# Altium project Bitirme_Projesi_FG1000.PrjPcb
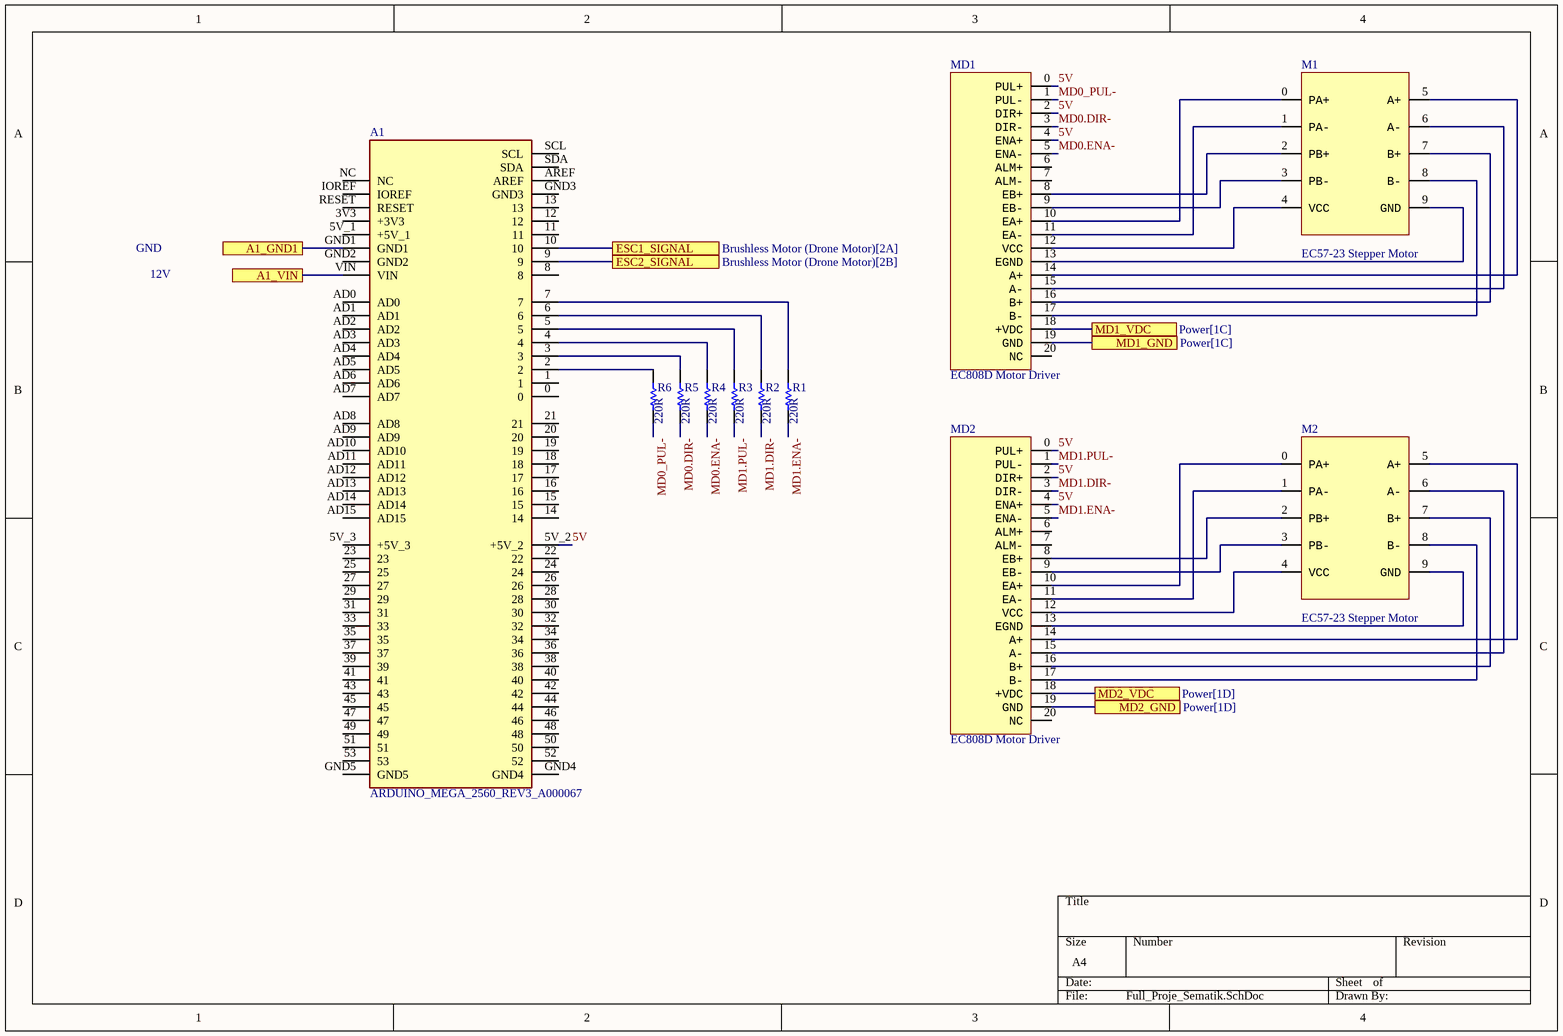
[diagram p0: Full_Proje_Sematik.SchDoc]
3 sheets, 54 parts. Net scope: flat (ports and power ports of the same name join across sheets).
Sheets:
  Full_Proje_Sematik.SchDoc
  Power.SchDoc
  Brushless Motor (Drone Motor).SchDoc

## Sheet Full_Proje_Sematik.SchDoc
size A4; SheetNumber: 1; SheetTotal: 3

### Parts
A1  ARDUINO_MEGA_2560_REV3_A000067  [ARDUINO_ARDUINO_MEGA_2560_REV3_A000067]
M1  EC57-23 Stepper Motor
M2  EC57-23 Stepper Motor
MD1  EC808D Motor Driver
MD2  EC808D Motor Driver
R1  value 220R  (hidden comment: Resistor)
R2  value 220R  (hidden comment: Resistor)
R3  value 220R  (hidden comment: Resistor)
R4  value 220R  (hidden comment: Resistor)
R5  value 220R  (hidden comment: Resistor)
R6  value 220R  (hidden comment: Resistor)

### Ports
A1_GND1, A1_VIN, ESC1_SIGNAL (see Brushless Motor (Drone Motor)[2A]), ESC2_SIGNAL (see Brushless Motor (Drone Motor)[2B]), MD1_GND (see Power[1C]), MD1_VDC (see Power[1C]), MD2_GND (see Power[1D]), MD2_VDC (see Power[1D])

### Nets
GND: MD1.19(GND) MD2.19(GND) ; port MD1_GND, port MD2_GND
5V: A1.5V_2(+5V_2) MD1.0(PUL+) MD1.2(DIR+) MD1.4(ENA+) MD2.0(PUL+) MD2.2(DIR+) MD2.4(ENA+)
48VDC: MD1.18(+VDC) MD2.18(+VDC) ; port MD1_VDC, port MD2_VDC
MD0.DIR-: MD1.3(DIR-) R5.2
MD0.ENA-: MD1.5(ENA-) R4.2
MD0_PUL-: MD1.1(PUL-) R6.2
MD1.DIR-: MD2.3(DIR-) R2.2
MD1.ENA-: MD2.5(ENA-) R1.2
MD1.PUL-: MD2.1(PUL-) R3.2
NetA1_2: A1.2 R6.1
NetA1_3: A1.3 R5.1
NetA1_4: A1.4 R4.1
NetA1_5: A1.5 R3.1
NetA1_6: A1.6 R2.1
NetA1_7: A1.7 R1.1
NetA1_9: A1.9 ; port ESC2_SIGNAL
NetA1_10: A1.10 ; port ESC1_SIGNAL
NetA1_GND1: A1.GND1 ; port A1_GND1
NetA1_VIN: A1.VIN ; port A1_VIN
NetM1_0: M1.0(PA+) MD1.10(EA+)
NetM1_1: M1.1(PA-) MD1.11(EA-)
NetM1_2: M1.2(PB+) MD1.8(EB+)
NetM1_3: M1.3(PB-) MD1.9(EB-)
NetM1_4: M1.4(VCC) MD1.12(VCC)
NetM1_5: M1.5(A+) MD1.14(A+)
NetM1_6: M1.6(A-) MD1.15(A-)
NetM1_7: M1.7(B+) MD1.16(B+)
NetM1_8: M1.8(B-) MD1.17(B-)
NetM1_9: M1.9(GND) MD1.13(EGND)
NetM2_0: M2.0(PA+) MD2.10(EA+)
NetM2_1: M2.1(PA-) MD2.11(EA-)
NetM2_2: M2.2(PB+) MD2.8(EB+)
NetM2_3: M2.3(PB-) MD2.9(EB-)
NetM2_4: M2.4(VCC) MD2.12(VCC)
NetM2_5: M2.5(A+) MD2.14(A+)
NetM2_6: M2.6(A-) MD2.15(A-)
NetM2_7: M2.7(B+) MD2.16(B+)
NetM2_8: M2.8(B-) MD2.17(B-)
NetM2_9: M2.9(GND) MD2.13(EGND)

Not connected (* = marked no-connect by the designer): A1 0 1 3V3(+3V3) 5V_1(+5V_1) 5V_3(+5V_3) 8 11 12 13 14 15 16 17 18 19 20 21 22 23 24 25 26 27 28 29 30 31 32 33 34 35 36 37 38 39 40 41 42 43 44 45 46 47 48 49 50 51 52 53 AD0 AD1 AD2 AD3 AD4 AD5 AD6 AD7 AD8 AD9 AD10 AD11 AD12 AD13 AD14 AD15 AREF GND2 GND3 GND4 GND5 IOREF NC RESET SCL SDA; MD1 6(ALM+) 7(ALM-) 20(NC); MD2 6(ALM+) 7(ALM-) 20(NC)

### Notes on the sheet
- GND
- 12V

### Library data of the parts
A1 = ARDUINO_MEGA_2560_REV3_A000067: ATmega2560 Arduino Mega2560 AVRÂ® ATmega AVR MCU 8-Bit Embedded Evaluation Board; MP: ARDUINO MEGA 2560 REV3 ¦ A000067; SnapEDA_Link: https://www.snapeda.com/parts/ARDUINO%20MEGA%202560%20REV3%20%7C%20A000067/Arduino/view-part/?ref=snap; Package: Non-Standard Arduino; Value: *; MF: Arduino; Check_prices: https://www.snapeda.com/parts/ARDUINO%20MEGA%202560%20REV3%20%7C%20A000067/Arduino/view-part/?ref=eda
R1-R6 = Resistor: TC1: 0; SimulationGenericComponent: True; TC2: 0

## Sheet Power.SchDoc
size A4; SheetNumber: 2; SheetTotal: 3; SPICEModelCacheLUYUMUGJ: <root> / <DocumentId>LUYUMUGJ</DocumentId> / </root>
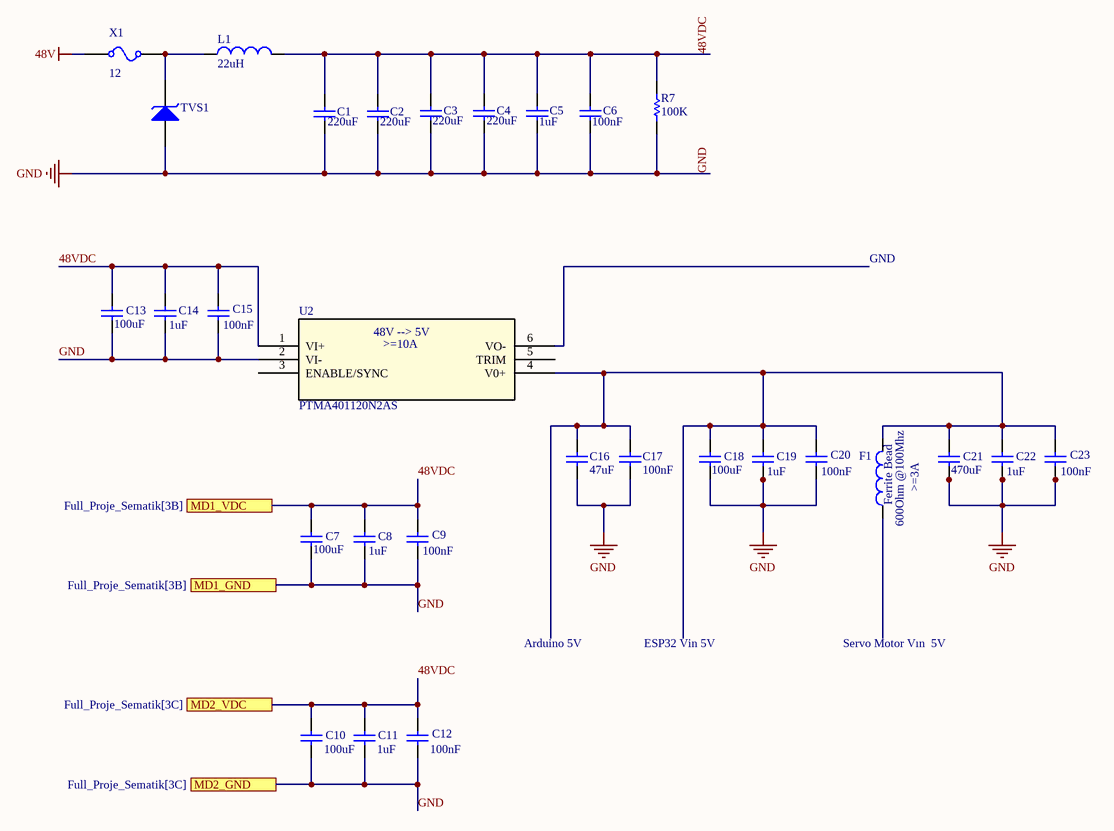
[diagram p1: Power.SchDoc]

### Parts
C1  value 220uF  (hidden comment: Capacitor)
C2  value 220uF  (hidden comment: Capacitor)
C3  value 220uF  (hidden comment: Capacitor)
C4  value 220uF  (hidden comment: Capacitor)
C5  value 1uF  (hidden comment: Capacitor)
C6  value 100nF  (hidden comment: Capacitor)
C7  value 100uF  (hidden comment: Capacitor)
C8  value 1uF  (hidden comment: Capacitor)
C9  value 100nF  (hidden comment: Capacitor)
C10  value 100uF  (hidden comment: Capacitor)
C11  value 1uF  (hidden comment: Capacitor)
C12  value 100nF  (hidden comment: Capacitor)
C13  value 100uF  (hidden comment: Capacitor)
C14  value 1uF  (hidden comment: Capacitor)
C15  value 100nF  (hidden comment: Capacitor)
C16  value 47uF  (hidden comment: Capacitor)
C17  value 100nF  (hidden comment: Capacitor)
C18  value 100uF  (hidden comment: Capacitor)
C19  value 1uF  (hidden comment: Capacitor)
C20  value 100nF  (hidden comment: Capacitor)
C21  value 470uF  (hidden comment: Capacitor)
C22  value 1uF  (hidden comment: Capacitor)
C23  value 100nF  (hidden comment: Capacitor)
F1  Ferrite Bead
L1  value 22uH  (hidden comment: Inductor)
R7  value 100K  (hidden comment: Resistor)
TVS1  Suppressor Single  (value not drawn)
U2  PTMA401120N2AS  [EET6]
X1  CURRENT: 12  (hidden comment: Fuse)

### Ports
MD1_GND (see Full_Proje_Sematik[3B]), MD1_VDC (see Full_Proje_Sematik[3B]), MD2_GND (see Full_Proje_Sematik[3C]), MD2_VDC (see Full_Proje_Sematik[3C])

### Nets
48V: X1.1
GND: C1.2 C2.1 C3.1 C4.1 C5.1 C6.1 C7.2 C8.2 C9.2 C10.2 C11.2 C12.2 C13.2 C14.2 C15.2 C16.2 C17.2 C18.2 C19.2 C20.2 C21.2 C22.2 C23.2 R7.1 TVS1.1(A) U2.2(VI-) ; port MD1_GND, port MD2_GND
48VDC: C1.1 C2.2 C3.2 C4.2 C5.2 C6.2 C7.1 C8.1 C9.1 C10.1 C11.1 C12.1 C13.1 C14.1 C15.1 L1.2 R7.2 U2.1(VI+) ; port MD1_VDC, port MD2_VDC
NetC16_1: C16.1 C17.1 C18.1 C19.1 C20.1 C21.1 C22.1 C23.1 F1.2 U2.4(V0+)
NetL1_1: L1.1 TVS1.2(K) X1.2

Not connected (* = marked no-connect by the designer): F1 1; U2 3(ENABLE/SYNC) 5(TRIM) 6(VO-)

### Notes on the sheet
- GND
- (near U2) 48V --> 5V
- (near U2) >=10A
- >=3A
- (near F1) 600Ohm @100Mhz
- Arduino 5V
- ESP32 Vin 5V
- Servo Motor Vın  5V

### Library data of the parts
C1-C4 C7 C10 C13 C16 C18 C21 = Capacitor: Bulk Capacitor 63V; SimulationGenericComponent: True
C5 C6 C8 C9 C11 C12 C14 C15 C17 C19 C20 C22 C23 = Capacitor: Seramic Capacitor 100V; SimulationGenericComponent: True
F1 = Inductor: Ferrite Bead 600Ohm @100Mhz; SimulationGenericComponent: True
L1 = Inductor: Inductor  >=10A; SimulationGenericComponent: True
R7 = Resistor: TC1: 0; SimulationGenericComponent: True; TC2: 0
TVS1 = Suppressor Single: 58V(VRWM) / 600–1500W / Unidirectional / SMBJ58A; AF: 1; BV: 0; BV_MAX: 1e99; EG: 1.11; FC: 0.5; IBV: 0.001; IS: 1e-14; MJSW: 0.33; NTUN: 30; TNOM: 27; XTI: 3; SimulationGenericComponent: True; CJO: 0; CJP: 0; CTA: 0; CTP: 0; FCS: 0.5; FV_MAX: 1e99; IKF: 0; IKR: 0; ISR: 1e-14; JSW: 0; JTUN: 0; JTUNSW: 0; KEG: 1; KF: 0; LEVEL: 1; N: 1; NBV: 1; NR: 1; NS: 1; PHP: 1; RS: 0; TCV: 0; TLEV: 0; TLEVC: 0; TM1: 0; TM2: 0; TPB: 0; TPHP: 0; TRS: 0; TRS2: 0; TT: 0; TTT1: 0; TTT2: 0; VJ: 1; XTITUN: 3
U2 = PTMA401120N2AS: No Description Available; Manufacturer_Name: Texas Instruments; Copyright: Copyright (C) 2026 Ultra Librarian. All rights reserved.; Manufacturer_Part_Number: PTMA401120N2AS; RefDes: RefDes; Type: Type
X1 = Fuse: 12A SLOW BLOW FUSE; RESISTANCE: 1m; SimulationGenericComponent: True

## Sheet Brushless Motor (Drone Motor).SchDoc
size A4; SheetNumber: 3; SheetTotal: 3
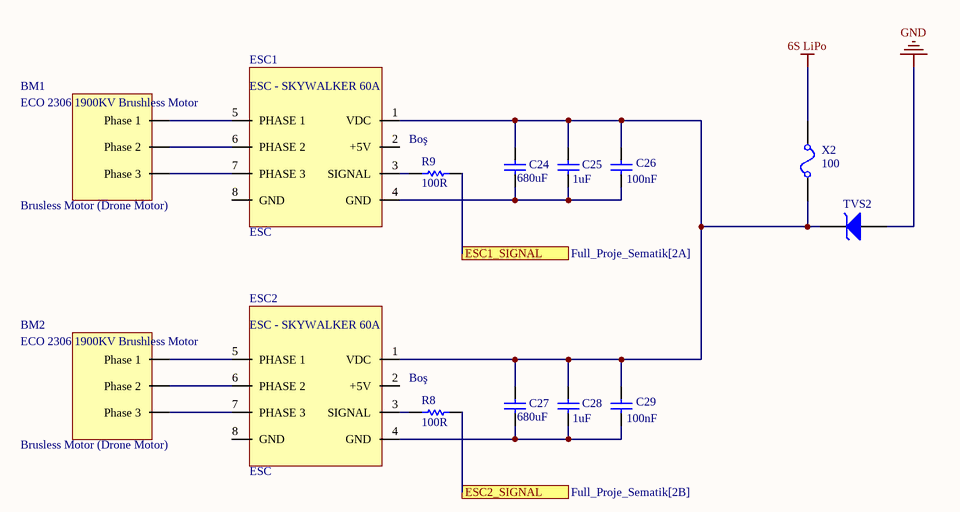
[diagram p2: Brushless Motor (Drone Motor).SchDoc]

### Parts
BM1  Brusless Motor (Drone Motor)
BM2  Brusless Motor (Drone Motor)
C24  value 680uF  (hidden comment: Capacitor)
C25  value 1uF  (hidden comment: Capacitor)
C26  value 100nF  (hidden comment: Capacitor)
C27  value 680uF  (hidden comment: Capacitor)
C28  value 1uF  (hidden comment: Capacitor)
C29  value 100nF  (hidden comment: Capacitor)
ESC1  ESC
ESC2  ESC
R8  value 100R  (hidden comment: Resistor)
R9  value 100R  (hidden comment: Resistor)
TVS2  Suppressor Single  (value not drawn)
X2  CURRENT: 100  (hidden comment: Fuse)

### Ports
ESC1_SIGNAL (see Full_Proje_Sematik[2A]), ESC2_SIGNAL (see Full_Proje_Sematik[2B])

### Nets
6S LiPo: X2.2
GND: TVS2.1(A)
NetA1_9: R8.2 ; port ESC2_SIGNAL
NetA1_10: R9.2 ; port ESC1_SIGNAL
NetBM1_0: BM1.0(Phase_1) ESC1.5(PHASE_1)
NetBM1_1: BM1.1(Phase_2) ESC1.6(PHASE_2)
NetBM1_2: BM1.2(Phase_3) ESC1.7(PHASE_3)
NetBM2_0: BM2.0(Phase_1) ESC2.5(PHASE_1)
NetBM2_1: BM2.1(Phase_2) ESC2.6(PHASE_2)
NetBM2_2: BM2.2(Phase_3) ESC2.7(PHASE_3)
NetC24_1: C24.1 C25.1 C26.1 C27.1 C28.1 C29.1 ESC1.1(VDC) ESC2.1(VDC) TVS2.2(K) X2.1
NetC24_2: C24.2 C25.2 C26.2 ESC1.4(GND)
NetC27_2: C27.2 C28.2 C29.2 ESC2.4(GND)
NetESC1_3: ESC1.3(SIGNAL) R9.1
NetESC2_3: ESC2.3(SIGNAL) R8.1

Not connected (* = marked no-connect by the designer): ESC1 2(+5V) 8(GND); ESC2 2(+5V) 8(GND)

### Notes on the sheet
- Boş
- (in symbol ESC) ESC - SKYWALKER 60A

### Library data of the parts
BM1 BM2 = Brusless Motor (Drone Motor): ECO 2306 1900KV Brushless Motor
C24 C27 = Capacitor: Bulk Capacitor 50V LOW ESR; SimulationGenericComponent: True
C25 C26 C28 C29 = Capacitor: Seramic Capacitor 50V X7R; SimulationGenericComponent: True
ESC1 ESC2 = ESC: SkyWalker 60A
R8 R9 = Resistor: TC1: 0; SimulationGenericComponent: True; TC2: 0
TVS2 = Suppressor Single: 33V (VRWM) / 1500W / Unidirectional / SMBJ33A; AF: 1; BV: 0; BV_MAX: 1e99; EG: 1.11; FC: 0.5; IBV: 0.001; IS: 1e-14; MJSW: 0.33; NTUN: 30; TNOM: 27; XTI: 3; SimulationGenericComponent: True; CJO: 0; CJP: 0; CTA: 0; CTP: 0; FCS: 0.5; FV_MAX: 1e99; IKF: 0; IKR: 0; ISR: 1e-14; JSW: 0; JTUN: 0; JTUNSW: 0; KEG: 1; KF: 0; LEVEL: 1; N: 1; NBV: 1; NR: 1; NS: 1; PHP: 1; RS: 0; TCV: 0; TLEV: 0; TLEVC: 0; TM1: 0; TM2: 0; TPB: 0; TPHP: 0; TRS: 0; TRS2: 0; TT: 0; TTT1: 0; TTT2: 0; VJ: 1; XTITUN: 3
X2 = Fuse: 100A Slow Blow Fuse; RESISTANCE: 1m; SimulationGenericComponent: True

## Nets that join several sheets
GND: Full_Proje_Sematik (MD1.19 MD2.19), Power (26 pins), Brushless Motor (Drone Motor) (TVS2.1)
48VDC: Full_Proje_Sematik (MD1.18 MD2.18), Power (18 pins)
NetA1_9: Full_Proje_Sematik (A1.9), Brushless Motor (Drone Motor) (R8.2)
NetA1_10: Full_Proje_Sematik (A1.10), Brushless Motor (Drone Motor) (R9.2)